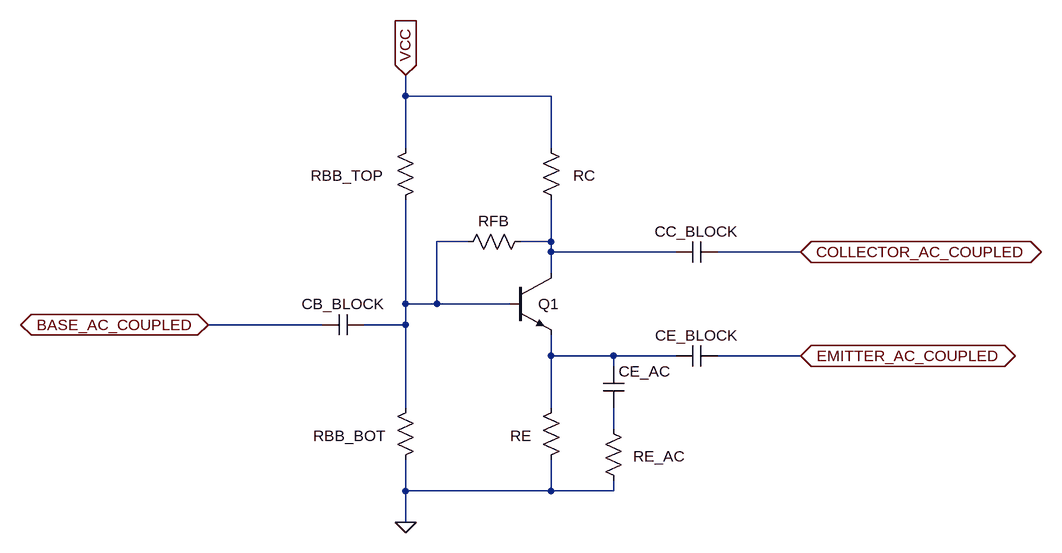
[diagram p0: schematic SCH_PIC.asc]
SCH_PIC.asc, the LTspice schematic file:
Version 4.1
SHEET 1 1136 680
WIRE 160 -128 160 -160
WIRE 384 -128 160 -128
WIRE 160 -48 160 -128
WIRE 384 -48 384 -128
WIRE 256 96 208 96
WIRE 384 96 384 32
WIRE 384 96 336 96
WIRE 384 112 384 96
WIRE 576 112 384 112
WIRE 768 112 640 112
WIRE 384 144 384 112
WIRE 160 192 160 32
WIRE 208 192 208 96
WIRE 208 192 160 192
WIRE 320 192 208 192
WIRE 32 224 -144 224
WIRE 160 224 160 192
WIRE 160 224 96 224
WIRE 384 272 384 240
WIRE 480 272 384 272
WIRE 576 272 480 272
WIRE 768 272 640 272
WIRE 480 288 480 272
WIRE 160 352 160 224
WIRE 384 352 384 272
WIRE 480 384 480 352
WIRE 160 480 160 432
WIRE 384 480 384 432
WIRE 384 480 160 480
WIRE 480 480 480 464
WIRE 480 480 384 480
WIRE 160 528 160 480
FLAG 160 528 0
FLAG 160 -160 VCC
IOPIN 160 -160 In
FLAG -144 224 BASE_AC_COUPLED
IOPIN -144 224 BiDir
FLAG 768 112 COLLECTOR_AC_COUPLED
IOPIN 768 112 BiDir
FLAG 768 272 EMITTER_AC_COUPLED
IOPIN 768 272 BiDir
SYMBOL npn 320 144 R0
WINDOW 0 44 48 Left 2
WINDOW 3 56 68 Invisible 2
SYMATTR InstName Q1
SYMBOL res 176 -64 M0
WINDOW 0 50 58 Left 2
WINDOW 3 36 76 Invisible 2
SYMATTR InstName RBB_TOP
SYMBOL res 176 336 M0
WINDOW 0 46 59 Left 2
WINDOW 3 36 76 Invisible 2
SYMATTR InstName RBB_BOT
SYMBOL res 240 112 R270
WINDOW 0 32 56 VTop 2
WINDOW 3 0 56 VBottom 2
SYMATTR InstName RFB
SYMATTR Value ""
SYMBOL res 368 -64 R0
WINDOW 0 50 58 Left 2
WINDOW 3 36 76 Invisible 2
SYMATTR InstName RC
SYMBOL res 400 336 M0
WINDOW 0 46 59 Left 2
WINDOW 3 36 76 Invisible 2
SYMATTR InstName RE
SYMBOL cap 464 288 R0
SYMATTR InstName CE_AC
SYMATTR Value ""
SYMBOL res 464 368 R0
WINDOW 0 46 59 Left 2
WINDOW 3 36 76 Invisible 2
SYMATTR InstName RE_AC
SYMBOL cap 96 208 R90
WINDOW 0 0 32 VBottom 2
WINDOW 3 32 32 VTop 2
SYMATTR InstName CB_BLOCK
SYMATTR Value ""
SYMBOL cap 640 96 R90
WINDOW 0 0 32 VBottom 2
WINDOW 3 32 32 VTop 2
SYMATTR InstName CC_BLOCK
SYMATTR Value ""
SYMBOL cap 640 256 R90
WINDOW 0 0 32 VBottom 2
WINDOW 3 32 32 VTop 2
SYMATTR InstName CE_BLOCK
SYMATTR Value ""

The netlist it stands for:
* SCH_PIC.asc
Q1 N002 N001 N003 0 NPN
RBB_TOP VCC N001 R
RBB_BOT N001 0 R
RFB N001 N002
RC VCC N002 R
RE N003 0 R
CE_AC N003 N004
RE_AC N004 0 R
CB_BLOCK N001 BASE_AC_COUPLED
CC_BLOCK COLLECTOR_AC_COUPLED N002
CE_BLOCK EMITTER_AC_COUPLED N003
.model NPN NPN
.model PNP PNP
.lib standard.bjt
.backanno
.end